# EasyEDA Pro project 辅助电源.epro, board 初级副板
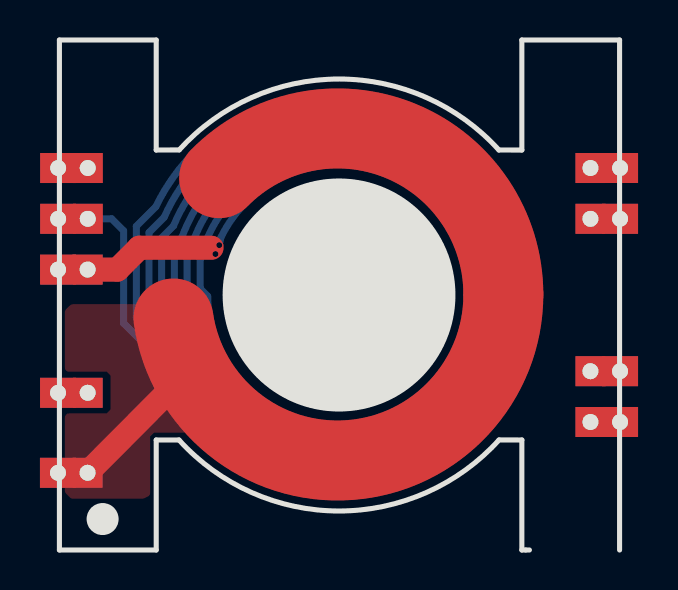
[diagram p7: board, top side]
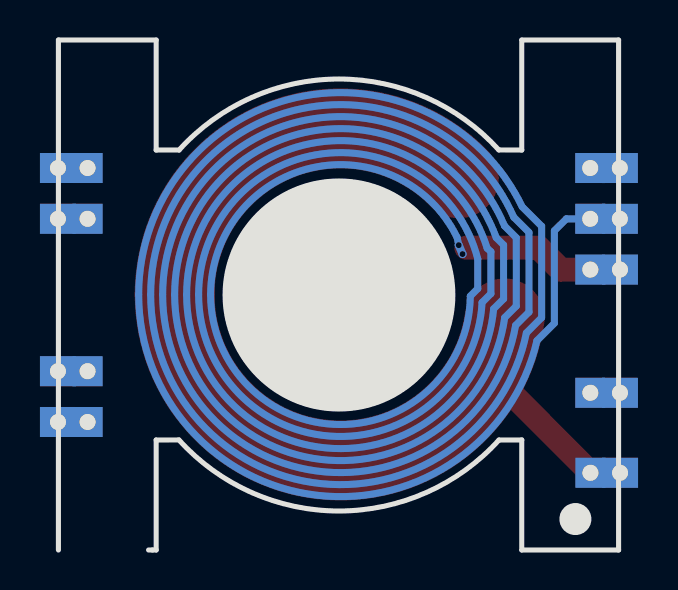
[diagram p8: board, bottom side, seen from below]

Outline 28.04 x 25.5 mm; copper layers: Top Layer, Inner1, Inner2, Bottom Layer. Coordinates in mm from the lower left corner of the outline.
Outline path: 4.85,25.5 0,25.5 0,0 4.85,0 ; 23.14,25.5 28.04,25.5 28.04,0 ; 23.14,0 23.52,0
Stack: Top Layer 0.035mm / Dielectric1 0.48mm PP er 4.5 / Inner1 0.035mm / Dielectric2 0.48mm FR4 er 4.5 / Inner2 0.035mm / Dielectric3 0.48mm PP er 4.5 / Bottom Layer 0.035mm

## Design rules (mm)
spacing Default (default): track to track 0.2, other pairs 0 to 0.2
spacing Plane_Default: track to track 0.2, other pairs 0 to 0.2
spacing Copper_Default: track to track 0.2, other pairs 0 to 0.2
spacing Copper_gge82110: track to track 0.2, other pairs 0 to 0.2
track width Default (default): min 0.2, default 0.2, max 25.4
differential pair differentialPair (default): width min 0.127, default 0.254, max 2.54; gap min 0.152, default 0.152
pour e137 uses Copper_Default, gge82110

## Placement (name value [footprint] x y rotation side)
NOREF  -  [Pad_e6]  28.06 6.4 0 top
NOREF#2  -  [Pad_e5]  28.06 8.94 0 top
NOREF#3  -  [Pad_e9]  -0.07 14.02 180 top
NOREF#4  -  [Pad_e11]  -0.06 19.1 180 top
NOREF#5  -  [Pad_e8]  -0.07 7.86 180 top
NOREF#6  -  [Pad_e3]  28.06 16.56 0 top
NOREF#7  -  [Pad_e10]  -0.06 16.56 180 top
NOREF#8  -  [Pad_e7]  -0.07 3.86 180 top
NOREF#9  -  [Pad_e4]  28.06 19.1 0 top
U1  -  [EQ2510_PCB]  14 12.75 0 top

## Footprints (pads in the part's own frame, mm; a bottom-side part is the same pattern mirrored in y, then rotated)
EQ2510_PCB
  rect 1.5x1.5 hole 0.8: 1(-12.576,6.351) 2(-12.576,3.811) 3(-12.581,1.271) 5(-12.581,-4.889) 6(-12.586,-8.889) 6(12.582,-6.349) 7(12.582,-3.809) 8(12.582,3.811) 9(12.582,6.351)
Pad_e3
  rect 1.8x1.5 hole 0.8: 8(0,0)
Pad_e4
  rect 1.8x1.5 hole 0.8: 9(0,0)
Pad_e5
  rect 1.8x1.5 hole 0.8: 7(0,0)
Pad_e6
  rect 1.8x1.5 hole 0.8: 6(0,0)
Pad_e7
  rect 1.8x1.5 hole 0.8: 6(0,0)
Pad_e8
  rect 1.8x1.5 hole 0.8: 5(0,0)
Pad_e9
  rect 1.8x1.5 hole 0.8: 3(0,0)
Pad_e10
  rect 1.8x1.5 hole 0.8: 2(0,0)
Pad_e11
  rect 1.8x1.5 hole 0.8: 1(0,0)

## Nets
+330V: NOREF#3.3 NOREF#7.2 U1.2 U1.3
PGND: NOREF#8.6

Pads without a net: NOREF 6; NOREF#2 7; NOREF#4 1; NOREF#5 5; NOREF#6 8; NOREF#9 9; U1 1 5 6 7 8 9

## Via types
v1: diameter 0.4, hole 0.3, Top Layer to Bottom Layer, 2 vias

## Routing (per net, layer and track width the routed paths; a pad name or vN(x,y) marks a point on that pad's centre or on a via; arc(x,y) is an arc through that point)
+330V: length 1118.5
  Top Layer w1.2: 1.41,14.02 2.9,14.02 4,15.11 7.62,15.11
  Inner1 w0.35: v1(8,15.24) 8.08,15.63 arc(15.39,19.1) 20.42,12.77 arc(13.96,6.28) 7.42,12.69 ; 5.7,11.62 5.12,12.2 5.12,15.61 5.71,16.21 arc(15.67,21.5) 22.82,12.77 arc(14.69,3.9) 5.15,11.23 ; 6.25,12.06 5.75,12.56 5.75,15.25 6.12,15.62 arc(15.37,20.94) 22.22,12.77 arc(14.5,4.49) 5.7,11.62 ; 7.42,12.69 7.05,13.07 7.05,14.56 arc(14.82,19.81) 21.02,12.77 ; 5.16,11.23 4.48,11.9 4.48,15.88 5.24,16.63 arc(15.89,22.06) 23.42,12.77 arc(14.88,3.32) 4.61,10.85 ; 4.61,10.85 3.85,11.62 3.85,16.19 4.82,17.16 arc(16.17,22.62) 24.02,12.77 arc(15.08,2.74) 4.09,10.47 3.21,11.34 3.21,15.96 2.61,16.56 1.42,16.56 ; 21.02,12.78 arc(14.12,5.68) 6.83,12.38 6.39,12.82 6.39,14.92 6.57,15.09 arc(15.09,20.38) 21.62,12.77 arc(14.28,5.08) 6.25,12.06
  Inner1 w0.4: v1(8,15.24) 7.81,14.8
  Inner2 w0.35: 6.58,15.09 6.39,14.92 6.39,12.82 6.83,12.38 arc(14.12,5.68) 21.02,12.78 ; 5.24,16.63 4.49,15.88 4.49,11.9 5.16,11.23 arc(14.69,3.9) 22.82,12.77 arc(15.67,21.5) 5.71,16.2 ; U1.2 2.61,16.56 3.21,15.96 3.21,11.34 4.09,10.47 ; 4.83,17.16 3.85,16.19 3.85,11.62 4.62,10.85 arc(14.88,3.32) 23.42,12.77 arc(15.89,22.06) 5.24,16.63 ; 5.7,11.62 5.12,12.2 5.12,15.61 5.71,16.21 ; 7.05,14.56 7.05,13.07 7.42,12.69 arc(13.96,6.27) 20.42,12.77 arc(15.39,19.1) 8.08,15.63 8,15.24 ; 5.7,11.61 arc(14.5,4.49) 22.22,12.77 arc(15.37,20.94) 6.12,15.62 5.76,15.25 5.76,12.56 6.25,12.06 arc(14.28,5.08) 21.62,12.77 arc(15.09,20.38) 6.58,15.09 ; 21.02,12.77 arc(14.82,19.81) 7.05,14.55 ; 4.09,10.47 arc(15.08,2.74) 24.02,12.77 ; 24.02,12.77 arc(16.17,22.62) 4.83,17.16
  Inner2 w0.4: 8,15.24 7.81,14.8
  Bottom Layer w0.35: 5.71,16.21 5.12,15.61 5.12,12.2 5.7,11.62 ; 8,15.24 8.08,15.63 arc(15.39,19.1) 20.42,12.77 arc(13.96,6.27) 7.42,12.69 7.05,13.07 7.05,14.56 ; 4.09,10.47 3.21,11.34 3.21,15.96 2.61,16.56 U1.2 ; 4.83,17.16 3.85,16.19 3.85,11.62 4.62,10.85 arc(14.88,3.32) 23.42,12.77 arc(15.89,22.06) 5.24,16.63 ; 5.24,16.63 4.49,15.88 4.49,11.9 5.16,11.23 arc(14.69,3.9) 22.82,12.77 arc(15.67,21.5) 5.71,16.2 ; 6.58,15.09 6.39,14.92 6.39,12.82 6.83,12.38 arc(14.12,5.68) 21.02,12.78 ; 4.09,10.47 arc(15.08,2.74) 24.02,12.77 ; 21.02,12.77 arc(14.82,19.81) 7.05,14.55 ; 24.02,12.77 arc(16.17,22.62) 4.83,17.16 ; 6.58,15.09 arc(15.09,20.38) 21.62,12.77 arc(14.28,5.08) 6.25,12.06 5.76,12.56 5.76,15.25 6.12,15.62 arc(15.37,20.94) 22.22,12.77 arc(14.5,4.49) 5.7,11.61
  Bottom Layer w0.4: 8,15.24 7.81,14.8
  vias: v1(7.81,14.8)
PGND: length 51.8
  Top Layer w1.2: 1.41,3.86 6.53,9
  Top Layer w4: 5.71,11.58 arc(14.52,4.5) 22.22,12.78 arc(17.06,20.46) 8,18.59

## Copper pours and planes (outline as drawn; the poured copper is in the pictures)
PGND on Top Layer: 0.38,2.92 0.38,11.94 0.63,12.19 6.35,12.19 6.35,5.97 4.69,5.97 4.44,5.72 4.44,2.79 4.19,2.67 0.63,2.67
